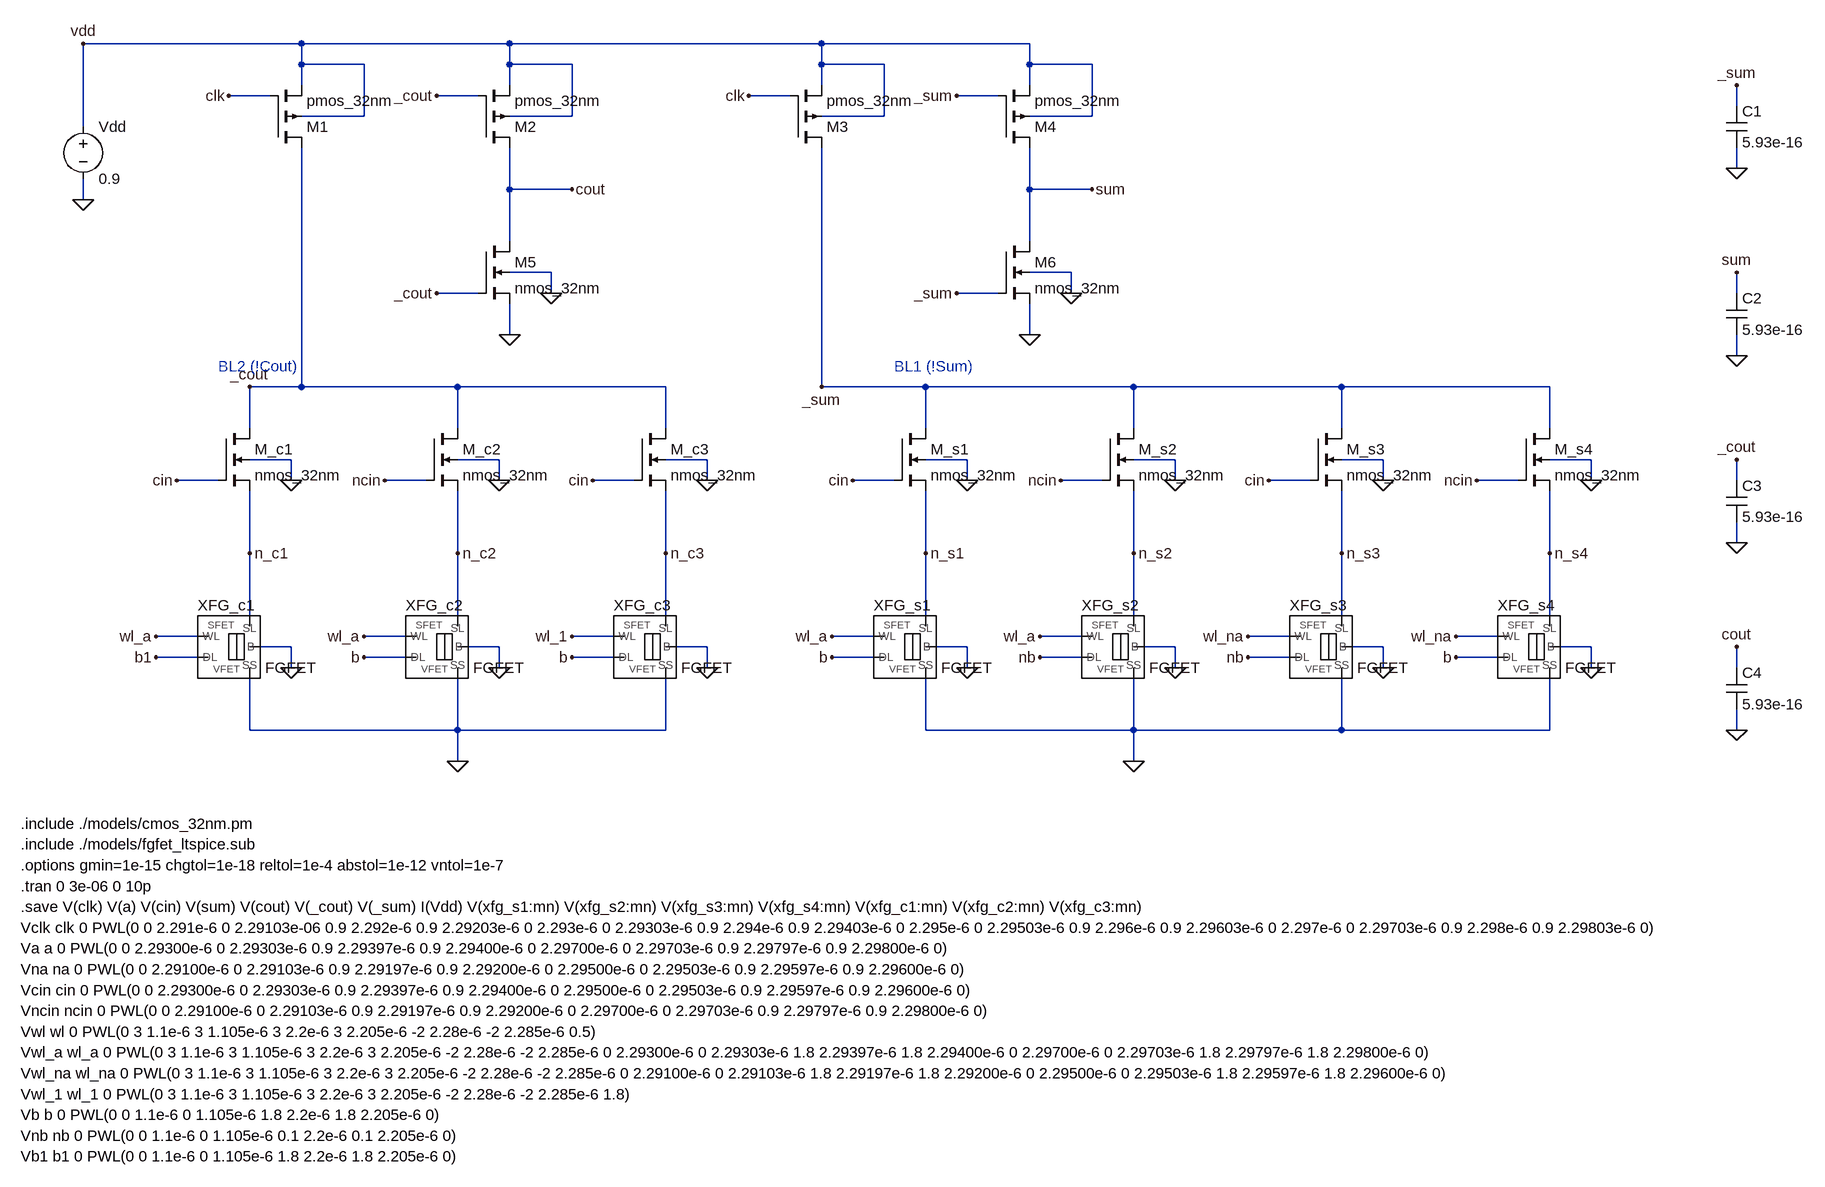
[diagram p0: schematic full_adder_btype.asc]
full_adder_btype.asc, the LTspice schematic file:
Version 4.1
SHEET 1 3980 1464
WIRE -768 -192 -768 -320
WIRE -768 -80 -768 -112
WIRE -768 -320 -432 -320
WIRE -432 -320 -112 -320
WIRE -112 -320 368 -320
WIRE 368 -320 688 -320
WIRE -432 -256 -432 -288
WIRE -432 -288 -432 -320
WIRE -432 -208 -336 -208
WIRE -336 -208 -336 -288
WIRE -336 -288 -432 -288
WIRE -480 -240 -544 -240
WIRE -432 -160 -432 208
WIRE -112 -256 -112 -288
WIRE -112 -288 -112 -320
WIRE -112 -208 -16 -208
WIRE -16 -208 -16 -288
WIRE -16 -288 -112 -288
WIRE -160 -240 -224 -240
WIRE -160 64 -224 64
WIRE -112 32 -48 32
WIRE -48 32 -48 64
WIRE -112 -160 -112 -96
WIRE -112 -96 -16 -96
WIRE -112 -96 -112 -16
WIRE -112 80 -112 128
WIRE 368 -256 368 -288
WIRE 368 -288 368 -320
WIRE 368 -208 464 -208
WIRE 464 -208 464 -288
WIRE 464 -288 368 -288
WIRE 320 -240 256 -240
WIRE 368 -160 368 208
WIRE 688 -256 688 -288
WIRE 688 -288 688 -320
WIRE 688 -208 784 -208
WIRE 784 -208 784 -288
WIRE 784 -288 688 -288
WIRE 640 -240 576 -240
WIRE 640 64 576 64
WIRE 688 32 752 32
WIRE 752 32 752 64
WIRE 688 -160 688 -96
WIRE 688 -96 784 -96
WIRE 688 -96 688 -16
WIRE 688 80 688 128
WIRE -512 208 -432 208
WIRE -432 208 -192 208
WIRE -192 208 128 208
WIRE -560 352 -624 352
WIRE -512 320 -448 320
WIRE -448 320 -448 352
WIRE -592 592 -656 592
WIRE -592 624 -656 624
WIRE -496 608 -448 608
WIRE -448 608 -448 640
WIRE -512 208 -512 272
WIRE -512 368 -512 560
WIRE -512 656 -512 736
WIRE -240 352 -304 352
WIRE -192 320 -128 320
WIRE -128 320 -128 352
WIRE -272 592 -336 592
WIRE -272 624 -336 624
WIRE -176 608 -128 608
WIRE -128 608 -128 640
WIRE -192 208 -192 272
WIRE -192 368 -192 560
WIRE -192 656 -192 736
WIRE 80 352 16 352
WIRE 128 320 192 320
WIRE 192 320 192 352
WIRE 48 592 -16 592
WIRE 48 624 -16 624
WIRE 144 608 192 608
WIRE 192 608 192 640
WIRE 128 208 128 272
WIRE 128 368 128 560
WIRE 128 656 128 736
WIRE -512 736 -192 736
WIRE -192 736 128 736
WIRE -192 736 -192 784
WIRE 368 208 528 208
WIRE 528 208 848 208
WIRE 848 208 1168 208
WIRE 1168 208 1488 208
WIRE 480 352 416 352
WIRE 528 320 592 320
WIRE 592 320 592 352
WIRE 448 592 384 592
WIRE 448 624 384 624
WIRE 544 608 592 608
WIRE 592 608 592 640
WIRE 528 208 528 272
WIRE 528 368 528 560
WIRE 528 656 528 736
WIRE 800 352 736 352
WIRE 848 320 912 320
WIRE 912 320 912 352
WIRE 768 592 704 592
WIRE 768 624 704 624
WIRE 864 608 912 608
WIRE 912 608 912 640
WIRE 848 208 848 272
WIRE 848 368 848 560
WIRE 848 656 848 736
WIRE 1120 352 1056 352
WIRE 1168 320 1232 320
WIRE 1232 320 1232 352
WIRE 1088 592 1024 592
WIRE 1088 624 1024 624
WIRE 1184 608 1232 608
WIRE 1232 608 1232 640
WIRE 1168 208 1168 272
WIRE 1168 368 1168 560
WIRE 1168 656 1168 736
WIRE 1440 352 1376 352
WIRE 1488 320 1552 320
WIRE 1552 320 1552 352
WIRE 1408 592 1344 592
WIRE 1408 624 1344 624
WIRE 1504 608 1552 608
WIRE 1552 608 1552 640
WIRE 1488 208 1488 272
WIRE 1488 368 1488 560
WIRE 1488 656 1488 736
WIRE 528 736 848 736
WIRE 848 736 1168 736
WIRE 1168 736 1488 736
WIRE 848 736 848 784
WIRE 1776 -224 1776 -256
WIRE 1776 -160 1776 -128
WIRE 1776 64 1776 32
WIRE 1776 128 1776 160
WIRE 1776 352 1776 320
WIRE 1776 416 1776 448
WIRE 1776 640 1776 608
WIRE 1776 704 1776 736
FLAG -768 -320 vdd
FLAG -768 -80 0
FLAG -544 -240 clk
FLAG -224 -240 _cout
FLAG -224 64 _cout
FLAG -48 64 0
FLAG -16 -96 cout
FLAG -112 128 0
FLAG 256 -240 clk
FLAG 576 -240 _sum
FLAG 576 64 _sum
FLAG 752 64 0
FLAG 784 -96 sum
FLAG 688 128 0
FLAG -512 208 _cout
FLAG -624 352 cin
FLAG -448 352 0
FLAG -656 592 wl_a
FLAG -656 624 b1
FLAG -448 640 0
FLAG -512 464 n_c1
FLAG -304 352 ncin
FLAG -128 352 0
FLAG -336 592 wl_a
FLAG -336 624 b
FLAG -128 640 0
FLAG -192 464 n_c2
FLAG 16 352 cin
FLAG 192 352 0
FLAG -16 592 wl_1
FLAG -16 624 b
FLAG 192 640 0
FLAG 128 464 n_c3
FLAG -192 784 0
FLAG 368 208 _sum
FLAG 416 352 cin
FLAG 592 352 0
FLAG 384 592 wl_a
FLAG 384 624 b
FLAG 592 640 0
FLAG 528 464 n_s1
FLAG 736 352 ncin
FLAG 912 352 0
FLAG 704 592 wl_a
FLAG 704 624 nb
FLAG 912 640 0
FLAG 848 464 n_s2
FLAG 1056 352 cin
FLAG 1232 352 0
FLAG 1024 592 wl_na
FLAG 1024 624 nb
FLAG 1232 640 0
FLAG 1168 464 n_s3
FLAG 1376 352 ncin
FLAG 1552 352 0
FLAG 1344 592 wl_na
FLAG 1344 624 b
FLAG 1552 640 0
FLAG 1488 464 n_s4
FLAG 848 784 0
FLAG 1776 -256 _sum
FLAG 1776 -128 0
FLAG 1776 32 sum
FLAG 1776 160 0
FLAG 1776 320 _cout
FLAG 1776 448 0
FLAG 1776 608 cout
FLAG 1776 736 0
SYMBOL voltage -768 -208 R0
SYMATTR InstName Vdd
SYMATTR Value 0.9
SYMBOL pmos4 -480 -160 M180
SYMATTR InstName M1
SYMATTR Value pmos_32nm
SYMATTR Value2 l=32n w=84.4n
SYMBOL pmos4 -160 -160 M180
SYMATTR InstName M2
SYMATTR Value pmos_32nm
SYMATTR Value2 l=32n w=156n
SYMBOL nmos4 -160 -16 R0
SYMATTR InstName M5
SYMATTR Value nmos_32nm
SYMATTR Value2 l=32n w=80n
SYMBOL pmos4 320 -160 M180
SYMATTR InstName M3
SYMATTR Value pmos_32nm
SYMATTR Value2 l=32n w=84.4n
SYMBOL pmos4 640 -160 M180
SYMATTR InstName M4
SYMATTR Value pmos_32nm
SYMATTR Value2 l=32n w=156n
SYMBOL nmos4 640 -16 R0
SYMATTR InstName M6
SYMATTR Value nmos_32nm
SYMATTR Value2 l=32n w=80n
SYMBOL nmos4 -560 272 R0
SYMATTR InstName M_c1
SYMATTR Value nmos_32nm
SYMATTR Value2 l=32n w=64n
SYMBOL FGFET -560 560 R0
SYMATTR SpiceLine w_dev=78.3n delvto_val=0.9
SYMATTR InstName XFG_c1
SYMBOL nmos4 -240 272 R0
SYMATTR InstName M_c2
SYMATTR Value nmos_32nm
SYMATTR Value2 l=32n w=64n
SYMBOL FGFET -240 560 R0
SYMATTR SpiceLine w_dev=78.3n delvto_val=0.9
SYMATTR InstName XFG_c2
SYMBOL nmos4 80 272 R0
SYMATTR InstName M_c3
SYMATTR Value nmos_32nm
SYMATTR Value2 l=32n w=64n
SYMBOL FGFET 80 560 R0
SYMATTR SpiceLine w_dev=78.3n delvto_val=0.9
SYMATTR InstName XFG_c3
SYMBOL nmos4 480 272 R0
SYMATTR InstName M_s1
SYMATTR Value nmos_32nm
SYMATTR Value2 l=32n w=64n
SYMBOL FGFET 480 560 R0
SYMATTR SpiceLine w_dev=78.3n delvto_val=0.9
SYMATTR InstName XFG_s1
SYMBOL nmos4 800 272 R0
SYMATTR InstName M_s2
SYMATTR Value nmos_32nm
SYMATTR Value2 l=32n w=64n
SYMBOL FGFET 800 560 R0
SYMATTR SpiceLine w_dev=78.3n delvto_val=0.9
SYMATTR InstName XFG_s2
SYMBOL nmos4 1120 272 R0
SYMATTR InstName M_s3
SYMATTR Value nmos_32nm
SYMATTR Value2 l=32n w=64n
SYMBOL FGFET 1120 560 R0
SYMATTR SpiceLine w_dev=78.3n delvto_val=0.9
SYMATTR InstName XFG_s3
SYMBOL nmos4 1440 272 R0
SYMATTR InstName M_s4
SYMATTR Value nmos_32nm
SYMATTR Value2 l=32n w=64n
SYMBOL FGFET 1440 560 R0
SYMATTR SpiceLine w_dev=78.3n delvto_val=0.9
SYMATTR InstName XFG_s4
SYMBOL cap 1760 -224 R0
SYMATTR Value 5.93e-16
SYMATTR InstName C1
SYMBOL cap 1760 64 R0
SYMATTR Value 5.93e-16
SYMATTR InstName C2
SYMBOL cap 1760 352 R0
SYMATTR Value 5.93e-16
SYMATTR InstName C3
SYMBOL cap 1760 640 R0
SYMATTR Value 5.93e-16
SYMATTR InstName C4
TEXT -560 176 Left 2 ;BL2 (!Cout)
TEXT 480 176 Left 2 ;BL1 (!Sum)
TEXT -864 880 Left 2 !.include ./models/cmos_32nm.pm
TEXT -864 912 Left 2 !.include ./models/fgfet_ltspice.sub
TEXT -864 944 Left 2 !.options gmin=1e-15 chgtol=1e-18 reltol=1e-4 abstol=1e-12 vntol=1e-7
TEXT -864 976 Left 2 !.tran 0 3e-06 0 10p
TEXT -864 1008 Left 2 !.save V(clk) V(a) V(cin) V(sum) V(cout) V(_cout) V(_sum) I(Vdd) V(xfg_s1:mn) V(xfg_s2:mn) V(xfg_s3:mn) V(xfg_s4:mn) V(xfg_c1:mn) V(xfg_c2:mn) V(xfg_c3:mn)
TEXT -864 1040 Left 2 !Vclk clk 0 PWL(0 0 2.291e-6 0 2.29103e-06 0.9 2.292e-6 0.9 2.29203e-6 0 2.293e-6 0 2.29303e-6 0.9 2.294e-6 0.9 2.29403e-6 0 2.295e-6 0 2.29503e-6 0.9 2.296e-6 0.9 2.29603e-6 0 2.297e-6 0 2.29703e-6 0.9 2.298e-6 0.9 2.29803e-6 0)
TEXT -864 1072 Left 2 !Va a 0 PWL(0 0 2.29300e-6 0 2.29303e-6 0.9 2.29397e-6 0.9 2.29400e-6 0 2.29700e-6 0 2.29703e-6 0.9 2.29797e-6 0.9 2.29800e-6 0)
TEXT -864 1104 Left 2 !Vna na 0 PWL(0 0 2.29100e-6 0 2.29103e-6 0.9 2.29197e-6 0.9 2.29200e-6 0 2.29500e-6 0 2.29503e-6 0.9 2.29597e-6 0.9 2.29600e-6 0)
TEXT -864 1136 Left 2 !Vcin cin 0 PWL(0 0 2.29300e-6 0 2.29303e-6 0.9 2.29397e-6 0.9 2.29400e-6 0 2.29500e-6 0 2.29503e-6 0.9 2.29597e-6 0.9 2.29600e-6 0)
TEXT -864 1168 Left 2 !Vncin ncin 0 PWL(0 0 2.29100e-6 0 2.29103e-6 0.9 2.29197e-6 0.9 2.29200e-6 0 2.29700e-6 0 2.29703e-6 0.9 2.29797e-6 0.9 2.29800e-6 0)
TEXT -864 1200 Left 2 !Vwl wl 0 PWL(0 3 1.1e-6 3 1.105e-6 3 2.2e-6 3 2.205e-6 -2 2.28e-6 -2 2.285e-6 0.5)
TEXT -864 1232 Left 2 !Vwl_a wl_a 0 PWL(0 3 1.1e-6 3 1.105e-6 3 2.2e-6 3 2.205e-6 -2 2.28e-6 -2 2.285e-6 0 2.29300e-6 0 2.29303e-6 1.8 2.29397e-6 1.8 2.29400e-6 0 2.29700e-6 0 2.29703e-6 1.8 2.29797e-6 1.8 2.29800e-6 0)
TEXT -864 1264 Left 2 !Vwl_na wl_na 0 PWL(0 3 1.1e-6 3 1.105e-6 3 2.2e-6 3 2.205e-6 -2 2.28e-6 -2 2.285e-6 0 2.29100e-6 0 2.29103e-6 1.8 2.29197e-6 1.8 2.29200e-6 0 2.29500e-6 0 2.29503e-6 1.8 2.29597e-6 1.8 2.29600e-6 0)
TEXT -864 1296 Left 2 !Vwl_1 wl_1 0 PWL(0 3 1.1e-6 3 1.105e-6 3 2.2e-6 3 2.205e-6 -2 2.28e-6 -2 2.285e-6 1.8)
TEXT -864 1328 Left 2 !Vb b 0 PWL(0 0 1.1e-6 0 1.105e-6 1.8 2.2e-6 1.8 2.205e-6 0)
TEXT -864 1360 Left 2 !Vnb nb 0 PWL(0 0 1.1e-6 0 1.105e-6 0.1 2.2e-6 0.1 2.205e-6 0)
TEXT -864 1392 Left 2 !Vb1 b1 0 PWL(0 0 1.1e-6 0 1.105e-6 1.8 2.2e-6 1.8 2.205e-6 0)

The netlist it stands for:
* full_adder_btype.asc
Vdd vdd 0 0.9
M1 _cout clk vdd vdd pmos_32nm l=32n w=84.4n
M2 cout _cout vdd vdd pmos_32nm l=32n w=156n
M5 cout _cout 0 0 nmos_32nm l=32n w=80n
M3 _sum clk vdd vdd pmos_32nm l=32n w=84.4n
M4 sum _sum vdd vdd pmos_32nm l=32n w=156n
M6 sum _sum 0 0 nmos_32nm l=32n w=80n
M_c1 _cout cin n_c1 0 nmos_32nm l=32n w=64n
X§XFG_c1 wl_a b1 n_c1 0 0 FGFET w_dev=78.3n delvto_val=0.9  ; pins WL DL SL SS B
M_c2 _cout ncin n_c2 0 nmos_32nm l=32n w=64n
X§XFG_c2 wl_a b n_c2 0 0 FGFET w_dev=78.3n delvto_val=0.9  ; pins WL DL SL SS B
M_c3 _cout cin n_c3 0 nmos_32nm l=32n w=64n
X§XFG_c3 wl_1 b n_c3 0 0 FGFET w_dev=78.3n delvto_val=0.9  ; pins WL DL SL SS B
M_s1 _sum cin n_s1 0 nmos_32nm l=32n w=64n
X§XFG_s1 wl_a b n_s1 0 0 FGFET w_dev=78.3n delvto_val=0.9  ; pins WL DL SL SS B
M_s2 _sum ncin n_s2 0 nmos_32nm l=32n w=64n
X§XFG_s2 wl_a nb n_s2 0 0 FGFET w_dev=78.3n delvto_val=0.9  ; pins WL DL SL SS B
M_s3 _sum cin n_s3 0 nmos_32nm l=32n w=64n
X§XFG_s3 wl_na nb n_s3 0 0 FGFET w_dev=78.3n delvto_val=0.9  ; pins WL DL SL SS B
M_s4 _sum ncin n_s4 0 nmos_32nm l=32n w=64n
X§XFG_s4 wl_na b n_s4 0 0 FGFET w_dev=78.3n delvto_val=0.9  ; pins WL DL SL SS B
C1 _sum 0 5.93e-16
C2 sum 0 5.93e-16
C3 _cout 0 5.93e-16
C4 cout 0 5.93e-16
.model NMOS NMOS
.model PMOS PMOS
.lib standard.mos
* BL2 (!Cout)
* BL1 (!Sum)
.include ./models/cmos_32nm.pm
.include ./models/fgfet_ltspice.sub
.options gmin=1e-15 chgtol=1e-18 reltol=1e-4 abstol=1e-12 vntol=1e-7
.tran 0 3e-06 0 10p
.save V(clk) V(a) V(cin) V(sum) V(cout) V(_cout) V(_sum) I(Vdd) V(xfg_s1:mn) V(xfg_s2:mn) V(xfg_s3:mn) V(xfg_s4:mn) V(xfg_c1:mn) V(xfg_c2:mn) V(xfg_c3:mn)
Vclk clk 0 PWL(0 0 2.291e-6 0 2.29103e-06 0.9 2.292e-6 0.9 2.29203e-6 0 2.293e-6 0 2.29303e-6 0.9 2.294e-6 0.9 2.29403e-6 0 2.295e-6 0 2.29503e-6 0.9 2.296e-6 0.9 2.29603e-6 0 2.297e-6 0 2.29703e-6 0.9 2.298e-6 0.9 2.29803e-6 0)
Va a 0 PWL(0 0 2.29300e-6 0 2.29303e-6 0.9 2.29397e-6 0.9 2.29400e-6 0 2.29700e-6 0 2.29703e-6 0.9 2.29797e-6 0.9 2.29800e-6 0)
Vna na 0 PWL(0 0 2.29100e-6 0 2.29103e-6 0.9 2.29197e-6 0.9 2.29200e-6 0 2.29500e-6 0 2.29503e-6 0.9 2.29597e-6 0.9 2.29600e-6 0)
Vcin cin 0 PWL(0 0 2.29300e-6 0 2.29303e-6 0.9 2.29397e-6 0.9 2.29400e-6 0 2.29500e-6 0 2.29503e-6 0.9 2.29597e-6 0.9 2.29600e-6 0)
Vncin ncin 0 PWL(0 0 2.29100e-6 0 2.29103e-6 0.9 2.29197e-6 0.9 2.29200e-6 0 2.29700e-6 0 2.29703e-6 0.9 2.29797e-6 0.9 2.29800e-6 0)
Vwl wl 0 PWL(0 3 1.1e-6 3 1.105e-6 3 2.2e-6 3 2.205e-6 -2 2.28e-6 -2 2.285e-6 0.5)
Vwl_a wl_a 0 PWL(0 3 1.1e-6 3 1.105e-6 3 2.2e-6 3 2.205e-6 -2 2.28e-6 -2 2.285e-6 0 2.29300e-6 0 2.29303e-6 1.8 2.29397e-6 1.8 2.29400e-6 0 2.29700e-6 0 2.29703e-6 1.8 2.29797e-6 1.8 2.29800e-6 0)
Vwl_na wl_na 0 PWL(0 3 1.1e-6 3 1.105e-6 3 2.2e-6 3 2.205e-6 -2 2.28e-6 -2 2.285e-6 0 2.29100e-6 0 2.29103e-6 1.8 2.29197e-6 1.8 2.29200e-6 0 2.29500e-6 0 2.29503e-6 1.8 2.29597e-6 1.8 2.29600e-6 0)
Vwl_1 wl_1 0 PWL(0 3 1.1e-6 3 1.105e-6 3 2.2e-6 3 2.205e-6 -2 2.28e-6 -2 2.285e-6 1.8)
Vb b 0 PWL(0 0 1.1e-6 0 1.105e-6 1.8 2.2e-6 1.8 2.205e-6 0)
Vnb nb 0 PWL(0 0 1.1e-6 0 1.105e-6 0.1 2.2e-6 0.1 2.205e-6 0)
Vb1 b1 0 PWL(0 0 1.1e-6 0 1.105e-6 1.8 2.2e-6 1.8 2.205e-6 0)
.backanno
.end